# Altium schematic sheet DAC_Reference.SchDoc: 09 - DAC de quatro canais e referencia de offset
size A3; Project: CM5 Photonic Bias Controller; DocumentRev: R5; ProjectRev: R5; Version: Rev R6; SheetNumber: 10; SheetTotal: 17; Author: Carlos Renan; SCH_SCALE: N/A; Address1: UFCG; Address2: Referencia: VIRTUS CC; Address3: Campina Grande - PB; ProjectName: Controle automatico de BIAS para MZM/IQ - Projeto 3; DocumentName: DAC_Reference.SchDoc
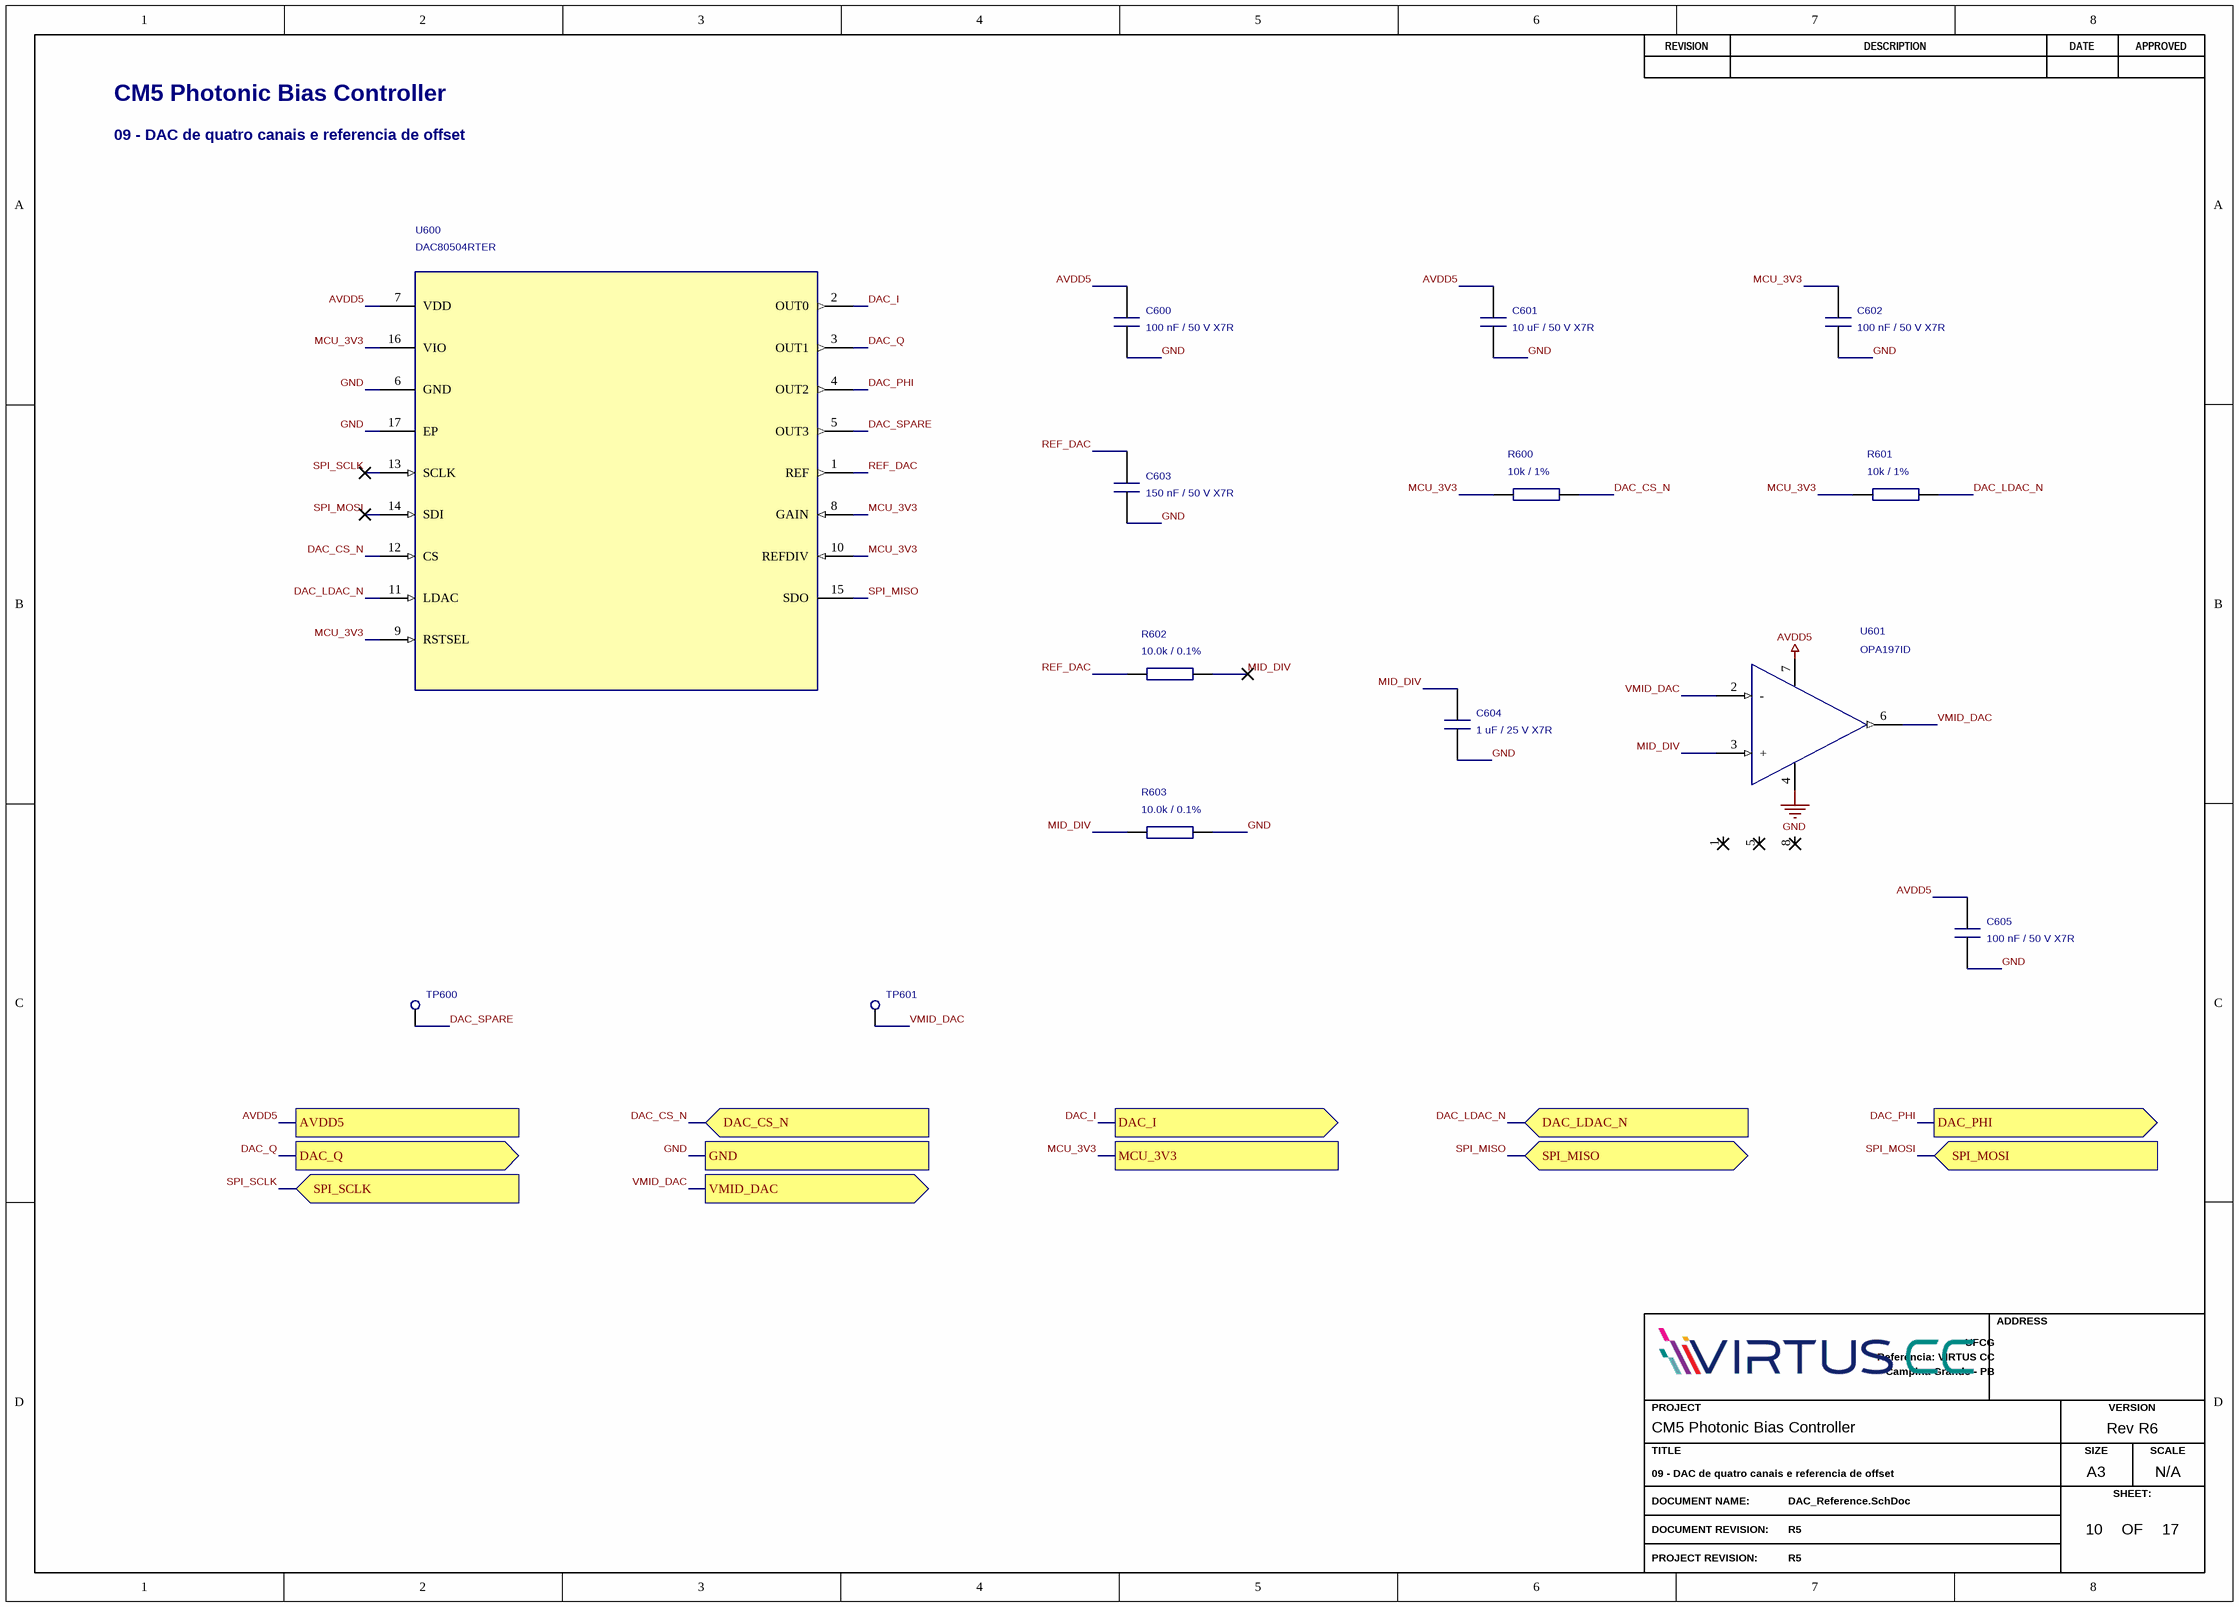
[diagram p0: DAC_Reference.SchDoc]

## Parts
C600  100 nF / 50 V X7R  [C0805]
C601  10 uF / 50 V X7R  [C1210]
C602  100 nF / 50 V X7R  [C0805]
C603  150 nF / 50 V X7R  [C1206]
C604  1 uF / 25 V X7R  [C0805]
C605  100 nF / 50 V X7R  [C0805]
R600  10k / 1%  [R-0603]
R601  10k / 1%  [R-0603]
R602  10.0k / 0.1%  [R-0603]
R603  10.0k / 0.1%  [R-0603]
TP600  Testpoint  [TP06R]  (value not drawn)
TP601  Testpoint  [TP06R]  (value not drawn)
U600  DAC80504RTER  [DAC80504_RTE]
U601  OPA197ID  [SOIC8]

## Ports
AVDD5, DAC_CS_N (in), DAC_I (out), DAC_LDAC_N (in), DAC_PHI (out), DAC_Q (out), GND, MCU_3V3, SPI_MISO (bidir), SPI_MOSI (in), SPI_SCLK (in), VMID_DAC (out)

## Nets
AVDD5: C600.1 C601.1 C605.1 U600.7(VDD) U601.7(V+) ; port AVDD5
GND: C600.2 C601.2 C602.2 C603.2 C604.2 C605.2 R603.2 U600.6(GND) U600.17(EP) U601.4(V-) ; port GND
DAC_CS_N: R600.2 U600.12(CS) ; port DAC_CS_N
DAC_I: U600.2(OUT0) ; port DAC_I
DAC_LDAC_N: R601.2 U600.11(LDAC) ; port DAC_LDAC_N
DAC_PHI: U600.4(OUT2) ; port DAC_PHI
DAC_Q: U600.3(OUT1) ; port DAC_Q
DAC_SPARE: TP600.1(TP) U600.5(OUT3)
MCU_3V3: C602.1 R600.1 R601.1 U600.8(GAIN) U600.9(RSTSEL) U600.10(REFDIV) U600.16(VIO) ; port MCU_3V3
MID_DIV: C604.1 R602.2 R603.1 U601.3(+)
REF_DAC: C603.1 R602.1 U600.1(REF)
SPI_MISO: U600.15(SDO) ; port SPI_MISO
SPI_MOSI: U600.14(SDI) ; port SPI_MOSI
SPI_SCLK: U600.13(SCLK) ; port SPI_SCLK
VMID_DAC: TP601.1(TP) U601.2(-) U601.6(OUT) ; port VMID_DAC

Not connected (* = marked no-connect by the designer): U601 1(NC)* 5(NC)* 8(NC)*

## Notes on the sheet
- CM5 Photonic Bias Controller
- 09 - DAC de quatro canais e referencia de offset
- REVISION
- DESCRIPTION
- DATE
- APPROVED
- ADDRESS
- PROJECT
- VERSION
- TITLE
- A3
- SIZE
- SCALE
- DOCUMENT NAME:
- DOCUMENT REVISION:
- OF
- SHEET:
- PROJECT REVISION:

## Library data of the parts
C600 C602 C605 = 100 nF: Manufacturer: KEMET; Manufacturer Part Number: C0805C104K5RACTU; Procurement Status: Busca por MPN; SKU e disponibilidade a confirmar; BOM Purchase: Yes; Manufacturer 1: KEMET; Manufacturer Part Number 1: C0805C104K5RACTU; Supplier 1: DigiKey; Supplier URL 1: https://www.digikey.com.br/pt/products/result?keywords=C0805C104K5RACTU; Supplier 2: Mouser; Supplier URL 2: https://br.mouser.com/c/?q=C0805C104K5RACTU; Datasheet: https://www.yageogroup.com/download/specsheet/C0805C104K5RACTU
C601 = 10 uF: Manufacturer: KEMET; Manufacturer Part Number: C1210C106K5RACTU; Procurement Status: Busca por MPN; SKU e disponibilidade a confirmar; BOM Purchase: Yes; Manufacturer 1: KEMET; Manufacturer Part Number 1: C1210C106K5RACTU; Supplier 1: DigiKey; Supplier URL 1: https://www.digikey.com.br/pt/products/result?keywords=C1210C106K5RACTU; Supplier 2: Mouser; Supplier URL 2: https://br.mouser.com/c/?q=C1210C106K5RACTU; Datasheet: https://www.yageogroup.com/download/specsheet/C1210C106K5RACTU
C603 = 150 nF: Manufacturer: KEMET; Manufacturer Part Number: C1206C154K5RACTU; Review: X7R no bypass da referencia; nao participa do polo Sallen-Key. Capacitancia nominal 150 nF.; Procurement Status: Busca por MPN; SKU e disponibilidade a confirmar; BOM Purchase: Yes; Manufacturer 1: KEMET; Manufacturer Part Number 1: C1206C154K5RACTU; Supplier 1: DigiKey; Supplier URL 1: https://www.digikey.com.br/pt/products/result?keywords=C1206C154K5RACTU; Supplier 2: Mouser; Supplier URL 2: https://br.mouser.com/c/?q=C1206C154K5RACTU; Datasheet: https://www.yageogroup.com/download/specsheet/C1206C154K5RACTU
C604 = 1 uF: Manufacturer: KEMET; Manufacturer Part Number: C0805C105K3RACTU; Procurement Status: Busca por MPN; SKU e disponibilidade a confirmar; BOM Purchase: Yes; Manufacturer 1: KEMET; Manufacturer Part Number 1: C0805C105K3RACTU; Supplier 1: DigiKey; Supplier URL 1: https://www.digikey.com.br/pt/products/result?keywords=C0805C105K3RACTU; Supplier 2: Mouser; Supplier URL 2: https://br.mouser.com/c/?q=C0805C105K3RACTU; Datasheet: https://www.yageogroup.com/download/specsheet/C0805C105K3RACTU
R600 R601 = 10k: Manufacturer: YAGEO; Manufacturer Part Number: RC0603FR-0710KL; Procurement Status: Busca por MPN; SKU e disponibilidade a confirmar; BOM Purchase: Yes; Manufacturer 1: YAGEO; Manufacturer Part Number 1: RC0603FR-0710KL; Supplier 1: DigiKey; Supplier URL 1: https://www.digikey.com.br/pt/products/result?keywords=RC0603FR-0710KL; Supplier 2: Mouser; Supplier URL 2: https://br.mouser.com/c/?q=RC0603FR-0710KL; Datasheet: https://www.yageo.com/en/Product/Index/rchip
R602 R603 = 10.0k: Manufacturer: YAGEO; Manufacturer Part Number: RT0603BRD0710KL; Review: Filme fino, 0,1%, 25 ppm/K; 0,1 W. Verificar dissipacao em R210/R212 e matching dos drivers.; Procurement Status: Busca por MPN; SKU e disponibilidade a confirmar; BOM Purchase: Yes; Manufacturer 1: YAGEO; Manufacturer Part Number 1: RT0603BRD0710KL; Supplier 1: DigiKey; Supplier URL 1: https://www.digikey.com.br/pt/products/result?keywords=RT0603BRD0710KL; Supplier 2: Mouser; Supplier URL 2: https://br.mouser.com/c/?q=RT0603BRD0710KL; Datasheet: https://www.yageo.com/en/Product/Index/rchip
TP600 TP601 = Testpoint: Review: Testpoint em cobre; excluido da BOM de compra.; Procurement Status: Recurso de cobre da PCB; nao comprar; BOM Purchase: No - PCB feature
U600 = DAC80504RTER: Manufacturer: Texas Instruments; Procurement Status: Busca por MPN; SKU e disponibilidade a confirmar; BOM Purchase: Yes; Manufacturer Part Number: DAC80504RTER; Manufacturer 1: Texas Instruments; Manufacturer Part Number 1: DAC80504RTER; Supplier 1: DigiKey; Supplier URL 1: https://www.digikey.com.br/pt/products/result?keywords=DAC80504RTER; Supplier 2: Mouser; Supplier URL 2: https://br.mouser.com/c/?q=DAC80504RTER; Datasheet: https://www.ti.com/lit/ds/symlink/dac80504.pdf
U601 = OPA197ID: Manufacturer: Texas Instruments; Procurement Status: Busca por MPN; SKU e disponibilidade a confirmar; BOM Purchase: Yes; Manufacturer Part Number: OPA197ID; Manufacturer 1: Texas Instruments; Manufacturer Part Number 1: OPA197ID; Supplier 1: DigiKey; Supplier URL 1: https://www.digikey.com.br/pt/products/result?keywords=OPA197ID; Supplier 2: Mouser; Supplier URL 2: https://br.mouser.com/c/?q=OPA197ID; Datasheet: https://www.ti.com/lit/ds/symlink/opa197.pdf